# Altium schematic sheet Amplifier_Sheet.SchDoc
size A4; DocumentNumber: 10; SheetNumber: 10; SheetTotal: 11
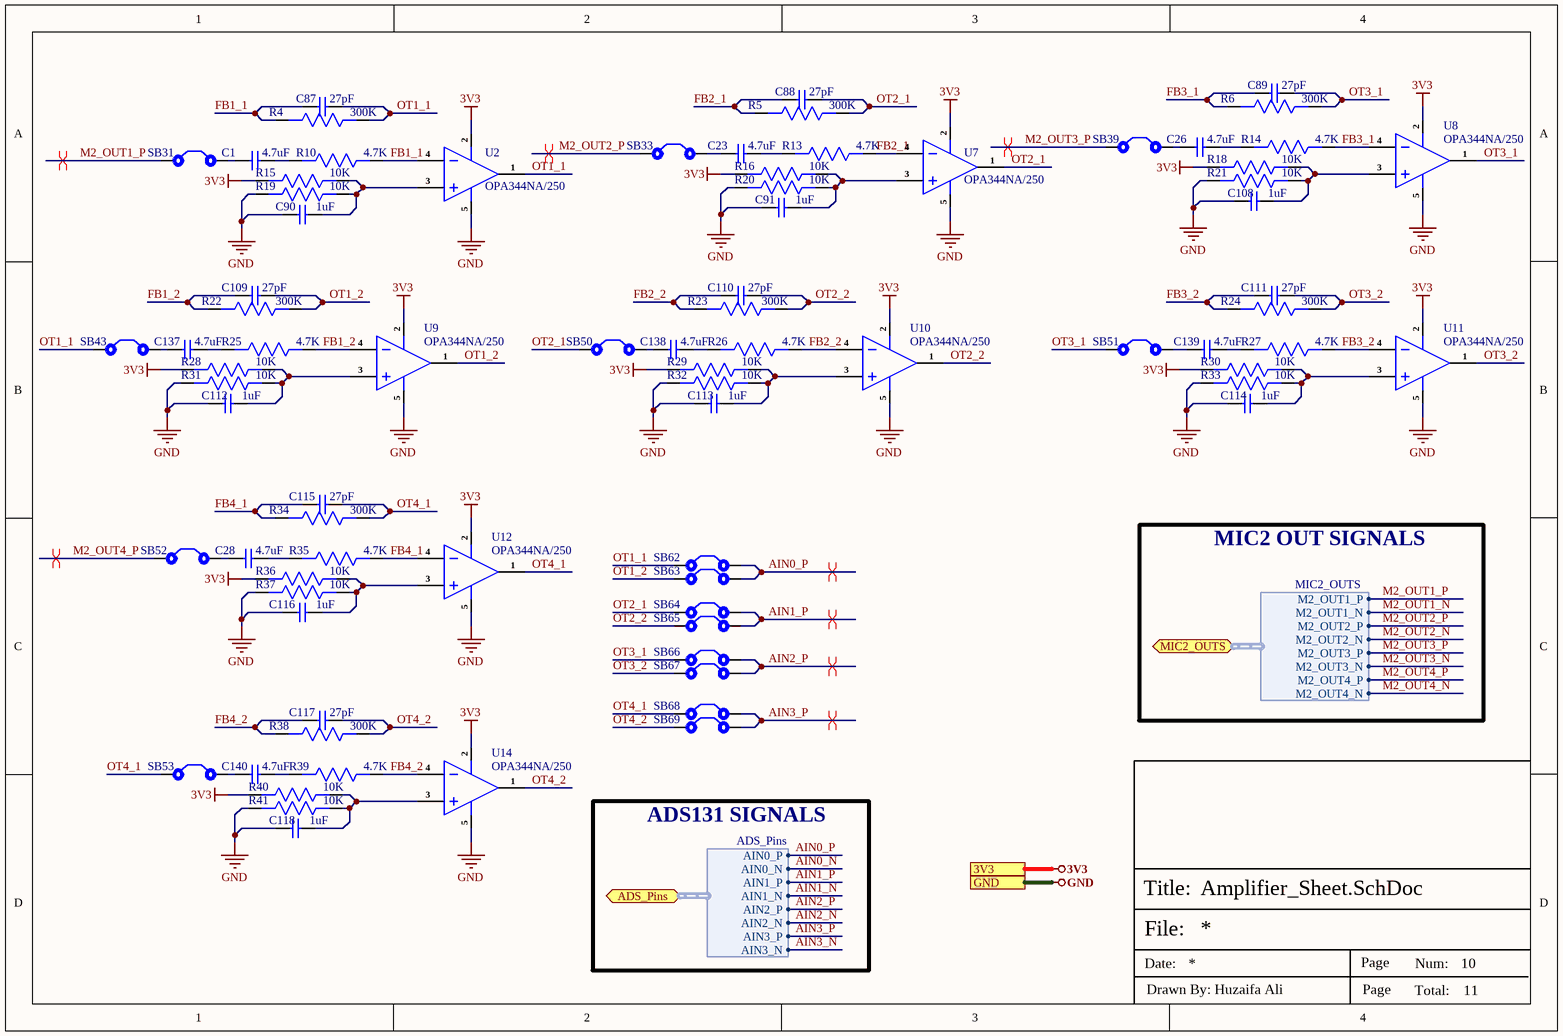
[diagram p0: Amplifier_Sheet.SchDoc]

## Parts
C1  4.7uF  [Cap-0603]
C23  4.7uF  [Cap-0603]
C26  4.7uF  [Cap-0603]
C28  4.7uF  [Cap-0603]
C87  27pF  [Cap-0603]
C88  27pF  [Cap-0603]
C89  27pF  [Cap-0603]
C90  1uF  [Cap-0402]
C91  1uF  [Cap-0402]
C108  1uF  [Cap-0402]
C109  27pF  [Cap-0603]
C110  27pF  [Cap-0603]
C111  27pF  [Cap-0603]
C112  1uF  [Cap-0402]
C113  1uF  [Cap-0402]
C114  1uF  [Cap-0402]
C115  27pF  [Cap-0603]
C116  1uF  [Cap-0402]
C117  27pF  [Cap-0603]
C118  1uF  [Cap-0402]
C137  4.7uF  [Cap-0603]
C138  4.7uF  [Cap-0603]
C139  4.7uF  [Cap-0603]
C140  4.7uF  [Cap-0603]
R4  300K  [Res-0603]
R5  300K  [Res-0603]
R6  300K  [Res-0603]
R10  4.7K  [Res-0603]
R13  4.7K  [Res-0603]
R14  4.7K  [Res-0603]
R15  10K  [Res-0402]
R16  10K  [Res-0402]
R18  10K  [Res-0402]
R19  10K  [Res-0402]
R20  10K  [Res-0402]
R21  10K  [Res-0402]
R22  300K  [Res-0603]
R23  300K  [Res-0603]
R24  300K  [Res-0603]
R25  4.7K  [Res-0603]
R26  4.7K  [Res-0603]
R27  4.7K  [Res-0603]
R28  10K  [Res-0402]
R29  10K  [Res-0402]
R30  10K  [Res-0402]
R31  10K  [Res-0402]
R32  10K  [Res-0402]
R33  10K  [Res-0402]
R34  300K  [Res-0603]
R35  4.7K  [Res-0603]
R36  10K  [Res-0402]
R37  10K  [Res-0402]
R38  300K  [Res-0603]
R39  4.7K  [Res-0603]
R40  10K  [Res-0402]
R41  10K  [Res-0402]
SB31  Solder Bridge  [Solder Bridge]  (value not drawn)
SB33  Solder Bridge  [Solder Bridge]  (value not drawn)
SB39  Solder Bridge  [Solder Bridge]  (value not drawn)
SB43  Solder Bridge  [Solder Bridge]  (value not drawn)
SB50  Solder Bridge  [Solder Bridge]  (value not drawn)
SB51  Solder Bridge  [Solder Bridge]  (value not drawn)
SB52  Solder Bridge  [Solder Bridge]  (value not drawn)
SB53  Solder Bridge  [Solder Bridge]  (value not drawn)
SB62  Solder Bridge  [Solder Bridge]  (value not drawn)
SB63  Solder Bridge  [Solder Bridge]  (value not drawn)
SB64  Solder Bridge  [Solder Bridge]  (value not drawn)
SB65  Solder Bridge  [Solder Bridge]  (value not drawn)
SB66  Solder Bridge  [Solder Bridge]  (value not drawn)
SB67  Solder Bridge  [Solder Bridge]  (value not drawn)
SB68  Solder Bridge  [Solder Bridge]  (value not drawn)
SB69  Solder Bridge  [Solder Bridge]  (value not drawn)
U2  OPA344NA/250  [SOT-23-5]
U7  OPA344NA/250  [SOT-23-5]
U8  OPA344NA/250  [SOT-23-5]
U9  OPA344NA/250  [SOT-23-5]
U10  OPA344NA/250  [SOT-23-5]
U11  OPA344NA/250  [SOT-23-5]
U12  OPA344NA/250  [SOT-23-5]
U14  OPA344NA/250  [SOT-23-5]

## Ports
3V3, ADS_Pins (bidir, harness ADS_Pins), GND, MIC2_OUTS (bidir, harness MIC2_OUTS)

## Harnesses
MIC2_OUTS: M2_OUT2_P, M2_OUT1_P, M2_OUT1_N, M2_OUT2_N, M2_OUT4_P, M2_OUT3_P, M2_OUT3_N, M2_OUT4_N
ADS_Pins: AIN2_P, AIN2_N, AIN3_N, AIN3_P, AIN0_P, AIN0_N, AIN1_N, AIN1_P

## Nets
3V3: R15.2 R16.2 R18.2 R28.2 R29.2 R30.2 R36.2 R40.2 U2.2(V-) U7.2(V-) U8.2(V-) U9.2(V-) U10.2(V-) U11.2(V-) U12.2(V-) U14.2(V-) ; port 3V3
GND: C90.1 C91.1 C108.1 C112.1 C113.1 C114.1 C116.1 C118.1 R19.2 R20.2 R21.2 R31.2 R32.2 R33.2 R37.2 R41.2 U2.5(V+) U7.5(V+) U8.5(V+) U9.5(V+) U10.5(V+) U11.5(V+) U12.5(V+) U14.5(V+) ; port GND
AIN0_N: port ADS_Pins.AIN0_N
AIN0_P: SB62.2 SB63.2 ; port ADS_Pins.AIN0_P
AIN1_N: port ADS_Pins.AIN1_N
AIN1_P: SB64.2 SB65.2 ; port ADS_Pins.AIN1_P
AIN2_N: port ADS_Pins.AIN2_N
AIN2_P: SB66.2 SB67.2 ; port ADS_Pins.AIN2_P
AIN3_N: port ADS_Pins.AIN3_N
AIN3_P: SB68.2 SB69.2 ; port ADS_Pins.AIN3_P
FB1_1: C87.1 R4.2 R10.1 U2.4(IN-)
FB1_2: C109.1 R22.2 R25.1 U9.4(IN-)
FB2_1: C88.1 R5.2 R13.1 U7.4(IN-)
FB2_2: C110.1 R23.2 R26.1 U10.4(IN-)
FB3_1: C89.1 R6.2 R14.1 U8.4(IN-)
FB3_2: C111.1 R24.2 R27.1 U11.4(IN-)
FB4_1: C115.1 R34.2 R35.1 U12.4(IN-)
FB4_2: C117.1 R38.2 R39.1 U14.4(IN-)
M2_OUT1_N: port MIC2_OUTS.M2_OUT1_N
M2_OUT1_P: SB31.1 ; port MIC2_OUTS.M2_OUT1_P
M2_OUT2_N: port MIC2_OUTS.M2_OUT2_N
M2_OUT2_P: SB33.1 ; port MIC2_OUTS.M2_OUT2_P
M2_OUT3_N: port MIC2_OUTS.M2_OUT3_N
M2_OUT3_P: SB39.1 ; port MIC2_OUTS.M2_OUT3_P
M2_OUT4_N: port MIC2_OUTS.M2_OUT4_N
M2_OUT4_P: SB52.1 ; port MIC2_OUTS.M2_OUT4_P
OT1_1: C87.2 R4.1 SB43.1 SB62.1 U2.1(OUT)
OT1_2: C109.2 R22.1 SB63.1 U9.1(OUT)
OT2_1: C88.2 R5.1 SB50.1 SB64.1 U7.1(OUT)
OT2_2: C110.2 R23.1 SB65.1 U10.1(OUT)
OT3_1: C89.2 R6.1 SB51.1 SB66.1 U8.1(OUT)
OT3_2: C111.2 R24.1 SB67.1 U11.1(OUT)
OT4_1: C115.2 R34.1 SB53.1 SB68.1 U12.1(OUT)
OT4_2: C117.2 R38.1 SB69.1 U14.1(OUT)
NetC1_1: C1.1 SB31.2
NetC1_2: C1.2 R10.2
NetC23_1: C23.1 SB33.2
NetC23_2: C23.2 R13.2
NetC26_1: C26.1 SB39.2
NetC26_2: C26.2 R14.2
NetC28_1: C28.1 SB52.2
NetC28_2: C28.2 R35.2
NetC90_2: C90.2 R15.1 R19.1 U2.3(IN+)
NetC91_2: C91.2 R16.1 R20.1 U7.3(IN+)
NetC108_2: C108.2 R18.1 R21.1 U8.3(IN+)
NetC112_2: C112.2 R28.1 R31.1 U9.3(IN+)
NetC113_2: C113.2 R29.1 R32.1 U10.3(IN+)
NetC114_2: C114.2 R30.1 R33.1 U11.3(IN+)
NetC116_2: C116.2 R36.1 R37.1 U12.3(IN+)
NetC118_2: C118.2 R40.1 R41.1 U14.3(IN+)
NetC137_1: C137.1 SB43.2
NetC137_2: C137.2 R25.2
NetC138_1: C138.1 SB50.2
NetC138_2: C138.2 R26.2
NetC139_1: C139.1 SB51.2
NetC139_2: C139.2 R27.2
NetC140_1: C140.1 SB53.2
NetC140_2: C140.2 R39.2

## Layout directives
differential pair; net class M2_OUT1; differential pair class M2_OUT1_Lines: M2_OUT1_P
differential pair; net class M2_OUT2; differential pair class M2_OUT2_Lines: M2_OUT2_P
differential pair; net class M2_OUT3; differential pair class M2_OUT3_Lines: M2_OUT3_P
differential pair; net class M2_OUT4; differential pair class M2_OUT4_Lines: M2_OUT4_P
differential pair; net class AIN0; differential pair class AIN0_Lines: AIN0_P
differential pair; net class AIN1; differential pair class AIN1_Lines: AIN1_P
differential pair; net class AIN2; differential pair class AIN2_Lines: AIN2_P
differential pair; net class AIN3; differential pair class AIN3_Lines: AIN3_P

## Notes on the sheet
- MIC2 OUT SIGNALS
- ADS131 SIGNALS
- File:
- Title:
- Date:
- Page
- Num:
- Total:
- Drawn By: Huzaifa Ali

## Library data of the parts
C1 C23 C26 C28 C137-C140 = CC0603KRX5R7BB475: CAP CER 4.7UF 16V X5R 0603; Manufacturer: Yageo; Tolerance: 10%; Supplier 1: Digi-Key; Manufacturer Part Number: CC0603KRX5R7BB475; RoHS: Yes; Category: Ceramic Capacitors; Stock 1: 547703; Pricing 1: 1=0.20000, 10=0.13800, 50=0.08280, 100=0.06990, 500=0.04784, 1000=0.04233 (USD); Mount: Surface Mount; Case/Package: 0603; Case Code (Imperial): 0603; Case Code (Metric): 1608; Weight: 7.1E-05oz; Min Operating Temperature: -55°C; Max Operating Temperature: 85°C; Capacitance: 4.7uF; Voltage Rating: 16V; Voltage Rating (DC): 16V; Packaging: Tape and Reel; Dielectric: X5R; Termination: SMD/SMT; Resistor Type: Ceramic; Series: CC; Length: 1.6mm; Width: 0.8mm; Height: 0.8mm; Thickness: 0.037inch; Depth: 0.8mm; Lead Free: Lead Free; Halogen Free: Halogen Free; RoHS Compliant: Yes; ComponentLink1URL: http://www.mouser.com/ds/2/447/UPY-GPHC_X5R_4V-to-50V_25-1131599.pdf?src-supplier=Mouser; ComponentLink1Description: http://www.mouser.com/ds/2/447/UPY-GPHC_X5R_4V-to-50V_25-1131599.pdf?src-supplier=Mouser; ComponentLink2URL: http://www.yageo.com/documents/recent/UPY-GPHC_X5R_4V-to-50V_25.pdf?src-supplier=Digi-Key; ComponentLink2Description: http://www.yageo.com/documents/recent/UPY-GPHC_X5R_4V-to-50V_25.pdf?src-supplier=Digi-Key; Supplier Part Number 1: 311-1785-1-ND; LCSC Part Number: C277476
C87-C89 C109-C111 C115 C117 = CC0603JRNPO9BN270: CAP CER 27PF 50V C0G/NPO 0603; Manufacturer: Yageo; Dielectric Material: Ceramic; Tolerance: 10%; Dielectric: C0G; Temperature Coefficient: 0ppm/°C; Insulation Resistance: 100GR; Supplier 1: Arrow Electronics; Manufacturer Part Number: CC0603JRNPO9BN270; RoHS: Yes; Category: Ceramic Capacitors; Stock 1: 1308000; Pricing 1: 4000=0.00590, 8000=0.00490, 28000=0.00480, 100000=0.00390 (USD); Mount: Surface Mount; Case/Package: 0603; Number of Pins: 2; Case Code (Metric): 1608; Case Code (Imperial): 0603; Min Operating Temperature: -55°C; Max Operating Temperature: 125°C; Capacitance: 27pF; Package Quantity: 1; Voltage Rating: 50V; Packaging: Tape and Reel; Voltage Rating (DC): 50V; Termination: SMD/SMT; Resistor Type: Ceramic; Voltage: 50V; Series: CC; Length: 1.6mm; Width: 0.031inch; Height: 0.8mm; Thickness: 0.035inch; Depth: 0.8mm; Radiation Hardening: No; REACH SVHC: Unknown; Lead Free: Lead Free; RoHS Compliant: Yes; ComponentLink1URL: https://datasheet.ciiva.com/26862/getdatasheetpartid-403529-26862764.pdf?src-supplier=Verical; ComponentLink1Description: https://datasheet.ciiva.com/26862/getdatasheetpartid-403529-26862764.pdf?src-supplier=Verical; ComponentLink2URL: https://datasheet.ciiva.com/8033/1443161-8033757.pdf?src-supplier=Element14; ComponentLink2Description: https://datasheet.ciiva.com/8033/1443161-8033757.pdf?src-supplier=Element14; ComponentLink3URL: https://datasheet.ciiva.com/46430/1835847-46430154.pdf?src-supplier=Element14; ComponentLink3Description: https://datasheet.ciiva.com/46430/1835847-46430154.pdf?src-supplier=Element14; ComponentLink4URL: https://datasheet.ciiva.com/144/mlccorderingcode-144641.pdf?src-supplier=Digi-Key; ComponentLink4Description: https://datasheet.ciiva.com/144/mlccorderingcode-144641.pdf?src-supplier=Digi-Key; ComponentLink5URL: https://datasheet.ciiva.com/144/mlccorderingcode-144640.pdf?src-supplier=Digi-Key; ComponentLink5Description: https://datasheet.ciiva.com/144/mlccorderingcode-144640.pdf?src-supplier=Digi-Key; ComponentLink6URL: https://datasheet.ciiva.com/144/mlccorderingcode-144642.pdf?src-supplier=Digi-Key; ComponentLink6Description: https://datasheet.ciiva.com/144/mlccorderingcode-144642.pdf?src-supplier=Digi-Key; ComponentLink7URL: https://datasheet.ciiva.com/8033/1734582-8033726.pdf?src-supplier=Element14; ComponentLink7Description: https://datasheet.ciiva.com/8033/1734582-8033726.pdf?src-supplier=Element14; ComponentLink8URL: https://datasheet.ciiva.com/8033/1734582-8033725.pdf?src-supplier=Element14; ComponentLink8Description: https://datasheet.ciiva.com/8033/1734582-8033725.pdf?src-supplier=Element14; ComponentLink9URL: https://datasheet.ciiva.com/11464/upy-gp-np0-16v-to-50v-8-11464729.pdf?src-supplier=Avnet; ComponentLink9Description: https://datasheet.ciiva.com/11464/upy-gp-np0-16v-to-50v-8-11464729.pdf?src-supplier=Avnet; Supplier Part Number 1: CC0603JRNPO9BN270; LCSC Part Number: C107045
C90 C91 C108 C112-C114 C116 C118 = CC0402KRX5R8BB105: CAP CER 1UF 25V X5R 0402; Manufacturer: Yageo; Tolerance: 10%; Supplier 1: Mouser; Manufacturer Part Number: CC0402KRX5R8BB105; RoHS: Yes; Category: Ceramic Capacitors; Stock 1: 91975; Pricing 1: 1=0.30000, 10=0.20400, 50=0.20400, 100=0.11600, 1000=0.07200, 10000=0.05900 (USD); Mount: Surface Mount; Case/Package: 0402; Case Code (Metric): 1005; Case Code (Imperial): 0402; Weight: 2.3E-05oz; Min Operating Temperature: -55°C; Max Operating Temperature: 85°C; Packaging: Tape and Reel; Capacitance: 1uF; Voltage Rating: 25V; Dielectric: X5R; Termination: SMD/SMT; Voltage Rating (DC): 25V; Package Quantity: 10000; Length: 0.039inch; Width: 0.02inch; Thickness: 0.022inch; Lead Free: Lead Free; Halogen Free: Halogen Free; RoHS Compliant: Yes; ComponentLink1URL: http://www.mouser.com/ds/2/447/Yageo_UPY-GP_NP0_16V-to-50V_9-358835.pdf?src-supplier=Mouser; ComponentLink1Description: http://www.mouser.com/ds/2/447/Yageo_UPY-GP_NP0_16V-to-50V_9-358835.pdf?src-supplier=Mouser; ComponentLink2URL: http://www.yageo.com/documents/recent/UPY-GPHC_X5R_4V-to-50V_25.pdf?src-supplier=Digi-Key; ComponentLink2Description: http://www.yageo.com/documents/recent/UPY-GPHC_X5R_4V-to-50V_25.pdf?src-supplier=Digi-Key; ComponentLink3URL: https://4donline.ihs.com/images/VipMasterIC/IC/YAGO/YAGO-S-A0006851646/YAGO-S-A0006851646-1.pdf?hkey=6D3A4C79FDBF58556ACFDE234799DDF0&src-supplier=Newark; ComponentLink3Description: https://4donline.ihs.com/images/VipMasterIC/IC/YAGO/YAGO-S-A0006851646/YAGO-S-A0006851646-1.pdf?hkey=6D3A4C79FDBF58556ACFDE234799DDF0&src-supplier=Newark; Supplier Part Number 1: 603-CC402KRX5R8BB105; LCSC Part Number: C326568
R4-R6 R22-R24 R34 R38 = RC0603FR-07300KL: RES 300K OHM 1% 1/10W 0603; Manufacturer: Yageo; Resistance: 300kR; Power Rating: 100mW; Temperature Coefficient: 100ppm/°C; Voltage Rating (DC): 50V; Item Type: Resistor; Supplier 1: Avnet; Manufacturer Part Number: RC0603FR-07300KL; RoHS: Yes; Category: Chip SMD Resistors; Stock 1: 25000; Pricing 1: 5000=0.00133, 10000=0.00131, 20000=0.00127 (USD); Mount: Surface Mount; Case/Package: 0603; Case Code (Metric): 1608; Case Code (Imperial): 0603; Size Code: 0603; Min Operating Temperature: -55°C; Max Operating Temperature: 155°C; Tolerance: 1%; Packaging: Tape and Reel; Package Quantity: 1; Voltage Rating: 50V; Resistor Type: Thick Film; Number of Terminations: 2; Termination: SMD/SMT; Max Power Dissipation: 100mW; Features: Moisture Resistant; Series: RC; Construction: Rectangular; Length: 0.063inch; Width: 0.031inch; Height: 0.022inch; Depth: 0.8mm; Lead Free: Lead Free; Military Standard: Not; RoHS Compliant: Yes; ComponentLink1URL: https://datasheet.ciiva.com/2454/pyu-r-int-thick-7-2454475.pdf?src-supplier=Digi-Key; ComponentLink1Description: https://datasheet.ciiva.com/2454/pyu-r-int-thick-7-2454475.pdf?src-supplier=Digi-Key; ComponentLink2URL: https://datasheet.ciiva.com/2454/pyu-r-int-thick-7-2454476.pdf?src-supplier=Digi-Key; ComponentLink2Description: https://datasheet.ciiva.com/2454/pyu-r-int-thick-7-2454476.pdf?src-supplier=Digi-Key; ComponentLink3URL: https://datasheet.ciiva.com/2454/pyu-r-int-thick-7-2454474.pdf?src-supplier=Digi-Key; ComponentLink3Description: https://datasheet.ciiva.com/2454/pyu-r-int-thick-7-2454474.pdf?src-supplier=Digi-Key; ComponentLink4URL: https://datasheet.ciiva.com/15189/getdatasheetpartid-348071-15189692.pdf?src-supplier=Verical; ComponentLink4Description: https://datasheet.ciiva.com/15189/getdatasheetpartid-348071-15189692.pdf?src-supplier=Verical; Supplier Part Number 1: RC0603FR-07300KL; LCSC Part Number: C114667
R10 R13 R14 R25-R27 R35 R39 = RC0603JR-074K7L: RES SMD 4.7K OHM 5% 1/10W 0603; Manufacturer: Yageo; Resistance: 4.7kR; Temperature Coefficient: 100ppm/°C; Voltage Rating (DC): 50V; Power Rating: 100mW; Supplier 1: Digi-Key; Manufacturer Part Number: RC0603JR-074K7L; Stock 1: 19706643; Pricing 1: 1=0.1, 10=0.02, 100=0.0081, 1000=0.00362, 2500=0.00314 (USD); Case/Package: 0603; Number of Pins: 2; Case Code (Imperial): 0603; Case Code (Metric): 1608; Min Operating Temperature: -55°C; Max Operating Temperature: 155°C; Tolerance: 5%; Composition: Thick Film; Packaging: Tape and Reel; Voltage Rating: 50V; Termination: SMD/SMT; Military Standard: Not; Length: 1.6mm; Width: 0.8mm; Depth: 0.8mm; REACH SVHC: No SVHC; Lead Free: Lead Free; ComponentLink1URL: http://www.farnell.com/datasheets/443971.pdf?src-supplier=Element14; ComponentLink1Description: http://www.farnell.com/datasheets/443971.pdf?src-supplier=Element14; Supplier Part Number 1: 311-4.7KGRCT-ND; LCSC Part Number: C105428
R15 R16 R18-R21 R28-R33 R36 R37 R40 R41 = RC0402FR-0710KL: RES 10K OHM 1% 1/16W 0402; Manufacturer: Yageo; Resistance: 10kR; Voltage Rating (DC): 50V; Temperature Coefficient: 100ppm/°C; Power Rating: 62.5mW; Max Power Dissipation: 63mW; Supplier 1: Mouser; Manufacturer Part Number: RC0402FR-0710KL; RoHS: Yes; Category: Chip SMD Resistors; Stock 1: 18648329; Pricing 1: 1=0.10000, 10=0.01400, 50=0.01400, 100=0.00500, 1000=0.00300, 10000=0.00200 (USD); Case/Package: 0402; Number of Pins: 2; Case Code (Imperial): 0402; Case Code (Metric): 1005; Min Operating Temperature: -55°C; Max Operating Temperature: 155°C; Resistor Type: Thick Film; Tolerance: 1%; Packaging: Tape and Reel; Voltage Rating: 50V; Termination: SMD/SMT; Working Voltage: 50V; Number of Terminations: 2; Features: Moisture Resistant; Series: RC; Resistance Tolerance: 1%; Construction: Rectangular; Length: 1mm; Width: 0.5mm; Height: 0.32mm; Depth: 0.5mm; Lead Pitch: 0.2mm; REACH SVHC: No SVHC; Lead Free: Lead Free; RoHS Compliant: Yes; Military Standard: Not; ComponentLink1URL: https://datasheet.ciiva.com/7660/38568-7660787.pdf?src-supplier=Element14; ComponentLink1Description: https://datasheet.ciiva.com/7660/38568-7660787.pdf?src-supplier=Element14; ComponentLink2URL: https://datasheet.ciiva.com/7849/1686128-7849814.pdf?src-supplier=Element14; ComponentLink2Description: https://datasheet.ciiva.com/7849/1686128-7849814.pdf?src-supplier=Element14; ComponentLink3URL: https://datasheet.ciiva.com/7983/1018594-7983486.pdf?src-supplier=Element14; ComponentLink3Description: https://datasheet.ciiva.com/7983/1018594-7983486.pdf?src-supplier=Element14; ComponentLink4URL: https://datasheet.ciiva.com/22747/1018594-22747512.pdf?src-supplier=Element14; ComponentLink4Description: https://datasheet.ciiva.com/22747/1018594-22747512.pdf?src-supplier=Element14; ComponentLink5URL: https://datasheet.ciiva.com/12667/pyu-rc0402-51-rohs-l-6-r-12667067.pdf?src-supplier=Mouser; ComponentLink5Description: https://datasheet.ciiva.com/12667/pyu-rc0402-51-rohs-l-6-r-12667067.pdf?src-supplier=Mouser; ComponentLink6URL: https://datasheet.ciiva.com/7849/1784430-7849813.pdf?src-supplier=Element14; ComponentLink6Description: https://datasheet.ciiva.com/7849/1784430-7849813.pdf?src-supplier=Element14; ComponentLink7URL: https://datasheet.ciiva.com/7849/1784430-7849815.pdf?src-supplier=Element14; ComponentLink7Description: https://datasheet.ciiva.com/7849/1784430-7849815.pdf?src-supplier=Element14; Supplier Part Number 1: 603-RC0402FR-0710KL; LCSC Part Number: C60490
SB31 SB33 SB39 SB43 SB50-SB53 SB62-SB69 = Solder Bridge: Solder Bridge ON
U2 U7-U12 U14 = OPA344NA/250: IC OPAMP GP 1 CIRCUIT SOT23-5; Manufacturer: Texas Instruments; Nominal Supply Current: 250uA; Bandwidth: 1MHz; Min Supply Voltage: 2.7V; Max Supply Voltage: 5.5V; Voltage Gain: 122dB; Common Mode Rejection Ratio: 76dB; Number of Channels: 1; Slew Rate: 0.8V/µs; Max I/O Voltage: 1mV; Input Bias Current: 10pA; Power Supply Rejection Ratio (PSRR): 90.46dB; Output Current per Channel: 15mA; Quiescent Current: 250mA; Supplier 1: Digi-Key; Manufacturer Part Number: OPA344NA/250; Stock 1: 6132; Pricing 1: 1=1.59, 10=1.43, 25=1.3492, 100=1.0794 (USD); Case/Package: SOT-23; Number of Pins: 5; Min Operating Temperature: -40°C; Max Operating Temperature: 85°C; Packaging: Tape and Reel; Package Quantity: 250; Unity Gain Bandwidth Product: 1MHz; Input Offset Voltage (Vos): 1mV; Gain Bandwidth Product: 1MHz; Number of Circuits: 1; Number of Amplifiers: 1; Number of Elements: 1; Length: 2.9mm; Height: 1.15mm; Width: 1.6mm; Radiation Hardening: No; REACH SVHC: No SVHC; Lead Free: Lead Free; ComponentLink1URL: http://www.ti.com/general/docs/lit/getliterature.tsp?genericPartNumber=OPA344&fileType=pdf&src-supplier=Newark; ComponentLink1Description: http://www.ti.com/general/docs/lit/getliterature.tsp?genericPartNumber=OPA344&fileType=pdf&src-supplier=Newark; ComponentLink2URL: http://www.farnell.com/datasheets/1882856.pdf?src-supplier=Element14; ComponentLink2Description: http://www.farnell.com/datasheets/1882856.pdf?src-supplier=Element14; ComponentLink3URL: http://www.ti.com/lit/ds/symlink/opa344.pdf?src-supplier=Digi-Key; ComponentLink3Description: http://www.ti.com/lit/ds/symlink/opa344.pdf?src-supplier=Digi-Key; ComponentLink4URL: http://focus.ti.com/lit/ds/symlink/opa344.pdf?src-supplier=Avnet+Europe; ComponentLink4Description: http://focus.ti.com/lit/ds/symlink/opa344.pdf?src-supplier=Avnet+Europe; ComponentLink5URL: http://www.ti.com/general/docs/lit/getliterature.tsp?genericPartNumber=OPA4345&&fileType=pdf&src-supplier=Avnet; ComponentLink5Description: http://www.ti.com/general/docs/lit/getliterature.tsp?genericPartNumber=OPA4345&&fileType=pdf&src-supplier=Avnet; Supplier Part Number 1: OPA344NACT-ND; LCSC Part Number: C131974; Item Type: IC